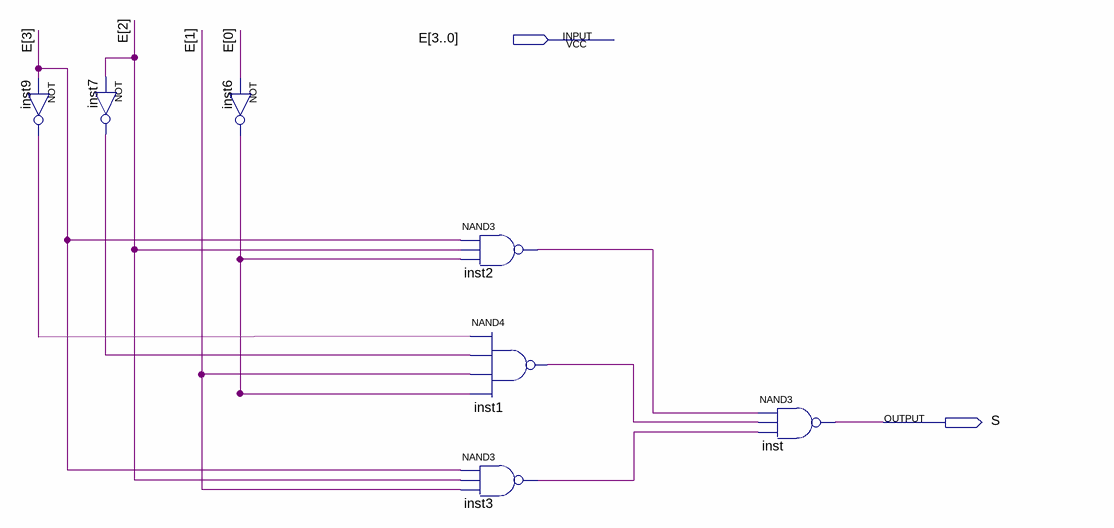
[diagram p0: schematic sheet]
// Quartus schematic S_C.bdf as structural Verilog: 7 symbols, 2 pins
module S_C (
  input  [3:0] E,
  output S
);

  wire inst1_out, inst2_out, inst3_out, inst6_out, inst7_out, inst9_out;

  not inst9 (inst9_out, E[3]);
  not inst7 (inst7_out, E[2]);
  not inst6 (inst6_out, E[0]);
  nand inst2 (inst2_out, E[3], E[2], inst6_out);
  nand inst3 (inst3_out, E[3], E[2], E[1]);
  nand inst1 (inst1_out, inst9_out, inst7_out, E[1], inst6_out);
  nand inst (S, inst2_out, inst1_out, inst3_out);
endmodule
